# Altium project Test.PrjPcb
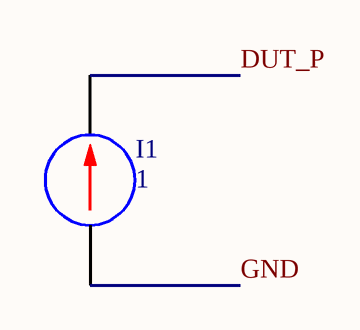
[diagram p0: Test.SchDoc]
1 sheet, 1 parts. Net scope: global (net labels, ports and power ports of the same name join across sheets).

## Sheet Test.SchDoc
size A4

### Parts
I1  DC: 1  (hidden comment: DC Current Source)

### Nets
DUT_P: I1.1(+)
GND: I1.2(-)

### Library data of the parts
I1 = DC Current Source: SimulationGenericComponent: True